# Altium schematic sheet Sheet2.SchDoc
size A; SheetNumber: 2; SheetTotal: 3
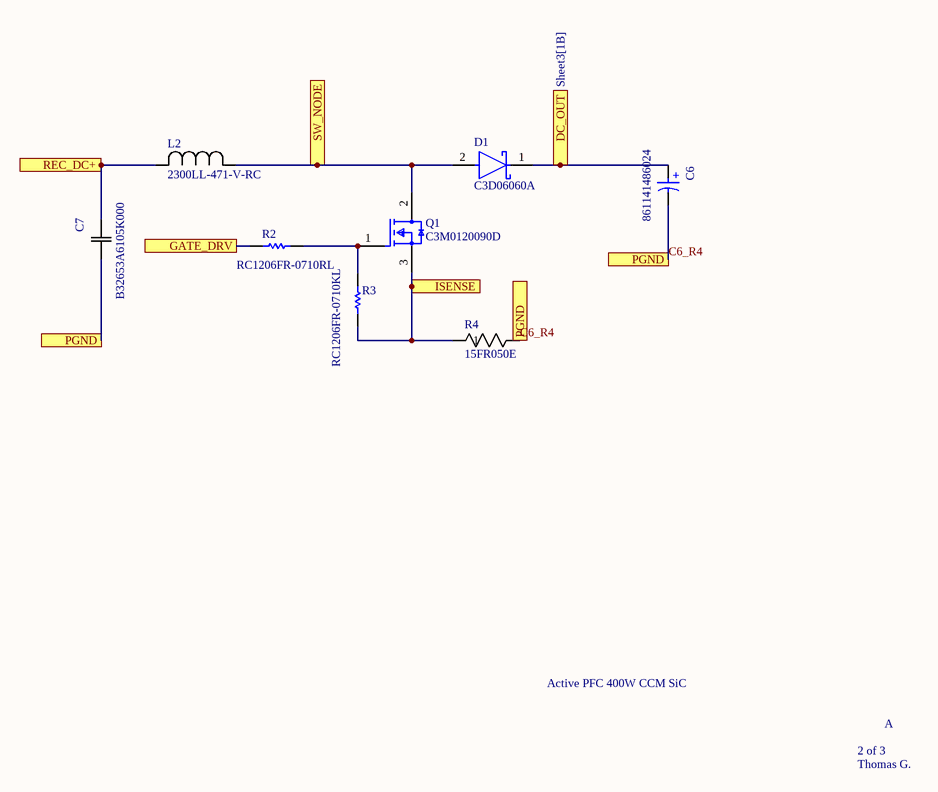
[diagram p0: Sheet2.SchDoc]

## Parts
C6  861141486024  [WCAP-AI3H_D35H50]
C7  B32653A6105K000  [CAP_B32653A--22.5--14.5x29.5x26.5_TDK]
D1  C3D06060A  [FP-TO-220-2-MFG]
L2  2300LL-471-V-RC  [IND_2300LL-V_52_34]
Q1  C3M0120090D  [FP-TO-247-3-MFG]
R2  RC1206FR-0710RL  [RESC3116X65X40ML10T20]
R3  RC1206FR-0710KL  [RESC3116X65X40ML10T20]
R4  15FR050E  [RES_15_OHM]

## Ports
DC_OUT (see Sheet3[1B]), GATE_DRV, ISENSE, PGND, REC_DC+, SW_NODE

## Nets
C6_R4: C6.2(N) C7.1 R4.2 ; port PGND
DC_OUT: C6.1(P) D1.1(C) ; port DC_OUT
GATE_DRV: R2.1 ; port GATE_DRV
ISENSE: Q1.3(S) R3.1 R4.1 ; port ISENSE
REC_DC+: C7.2 L2.2 ; port REC_DC+
SW_NODE: D1.2(A) L2.1 Q1.2(D) ; port SW_NODE
NetQ1_1: Q1.1(G) R2.2 R3.2

## Notes on the sheet
- Active PFC 400W CCM SiC
- 2 of 3
- A
- Thomas G.
- (in symbol CMP-03913-54202429-3) +

## Library data of the parts
C6 = CMP-03913-54202429-3: Electrolytic Capacitor, Snap-in, WCAP-AI3H Series, 470 F, 20%, 450 V, 35 mm RoHS Compliant: Yes; Manufacturer Lifecycle Status: ACTIVE; Ripple Current: 1.85A; Life (Hours): 3000hours; Voltage Rating (DC): 450V; YEOL: 1 = Estimated lifetime > 10 years; ESR (Equivalent Series Resistance): 195mΩ; Pitch: 10mm; Capacitance: 470µF; Polarity: Polar; Leakage Current: 1.37967mA; Length: 52mm; Lifecycle Status: Production; Diameter: 35mm; Max Operating Temperature: 105°C; Min Operating Temperature: -25°C; Case/Package: Radial; RoHS: Compliant; Mount: Through Hole; REACH SVHC: Unknown; Lead Pitch: 10.0076mm; Voltage Rating: 450V; Height - Seated (Max): 54.0004mm; Height: 52mm; Tolerance: 20%
C7 = B32653A6105K000: No Description Available; Manufacturer_Name: TDK; Copyright: Copyright (C) 2026 Ultra Librarian. All rights reserved.; Manufacturer_Part_Number: B32653A6105K000
D1 = CMP-240925-000090-2: DIODE SCHOTTKY 600V 6A TO220-2; Average Rectified Current: 19A; Forward Voltage: 1.8V; Element Configuration: Single; Max Reverse Current: 50uA; Max Power Dissipation: 79W; Reverse Recovery Time: 0ns; Max Forward Surge Current (Ifsm): 70A; Width: 4.699mm; Number of Pins: 2; Max Operating Temperature: 175°C; Min Operating Temperature: -55°C; Length: 10.41mm; Max Repetitive Reverse Voltage (Vrrm): 600V; Package Quantity: 50; Series: Z-Rec®; Case/Package: TO-220; Forward Current: 6A; Radiation Hardening: No; Max Reverse Voltage (DC): 600V; Height: 15.621mm; RoHS Compliant: Yes; Peak Non-Repetitive Surge Current: 70A; Packaging: Rail/Tube; Mount: Through Hole
L2 = 2300LL-471-V-RC: No Description Available; Manufacturer_Name: Bourns Electronics; Copyright: Copyright (C) 2026 Ultra Librarian. All rights reserved.; Manufacturer_Part_Number: 2300LL-471-V-RC
Q1 = CMP-240936-000102-3: SICFET N-CH 900V 23A TO247-3; Input Capacitance: 350pF; Rds On Max: 155mR; Threshold Voltage: 2.1V; Max Power Dissipation: 97W; RoHS Compliant: Yes; Drain to Source Voltage (Vdss): 900V; Mount: Through Hole; Series: C3M™; Packaging: Rail/Tube; Case/Package: TO-247-3; Max Operating Temperature: 150°C; Min Operating Temperature: -55°C; Number of Pins: 3; Continuous Drain Current (ID): 23A; Reach SVHC Compliant: Yes
R2 = CMP-2100-03677-1: Chip Resistor, 10 Ohm, +/- 1%, 0.25 W, -55 to 155 degC, 1206 (3216 Metric), RoHS, Tape and Reel; Manufacturer: Yageo; Voltage Rating (DC): 200V; Resistance: 10Ohm; Power Rating: 250mW; Temperature Coefficient: 200ppm/degreesC; Military Standard: Not; Package Description: 2-Pin Surface Mount Device, Body 3.1 x 1.6 mm; Packaging: TapeandReel; Datasheet Version: Rev. 5, 10/2016; Length: 3.1mm; Manufacturer URL: http://www.yageo.com/; Voltage Rating: 200V; Height: 0.026inch; REACH SVHC: Unknown; Max Operating Temperature: 155degC; Case Code (Imperial): 1206; Package Reference: 1206.0; RoHSCompliant: true; Termination: SMD/SMT; Lead Free: LeadFree; Composition: ThickFilm; Tolerance: 1%; Package Quantity: 1; Min Operating Temperature: -55degC; Datasheet URL: http://www.yageo.com/NewPortal/yageodocoutput?fileName=/pdf/R-Chip/PYu-RC_Group_51_RoHS_L_5.pdf; Number of Pins: 2; Width: 0.063inch; Case Code (Metric): 3216; Max Power Dissipation: 250mW; Depth: 1.6mm; Number of Terminations: 2; Case/Package: 1206
R3 = CMP-1014-00623-2: Chip Resistor, 10 KOhm, +/- 1%, 0.25 W, -55 to 155 degC, 1206 (3216 Metric), RoHS, Tape and Reel; Manufacturer: Yageo; Voltage Rating: 200V; Resistance: 10KOhm; Temperature Coefficient: 100ppm/degreesC; Power Rating: 250mW; Packaging: TapeandReel; Termination: SMD/SMT; REACH SVHC: Unknown; Tolerance: 1%; Height: 0.55mm; Composition: ThickFilm; Max Operating Temperature: 155degC; Datasheet Version: Rev. 5, 10/2016; Lead Free: LeadFree; Case Code (Metric): 3216; Depth: 1.6mm; Package Quantity: 5000; RoHSCompliant: true; Military Standard: Not; Case/Package: 1206; Case Code (Imperial): 1206; Min Operating Temperature: -55degC; Datasheet URL: http://www.yageo.com/NewPortal/yageodocoutput?fileName=/pdf/R-Chip/PYu-RC_Group_51_RoHS_L_5.pdf; Length: 3.1mm; Manufacturer URL: http://www.yageo.com/; Package Reference: 1206.0; Width: 1.6mm; Package Description: 2-Pin Surface Mount Device, Body 3.1 x 1.6 mm
R4 = 15FR050E: Description; Manufacturer_Name: Ohmite; Copyright: Copyright (C) 2025 Ultra Librarian. All rights reserved.; Manufacturer_Part_Number: 15FR050E